# EasyEDA Pro project 4轴机器狗主控板_ProDoc_Board1_2026-10-02.epro, board PCB1
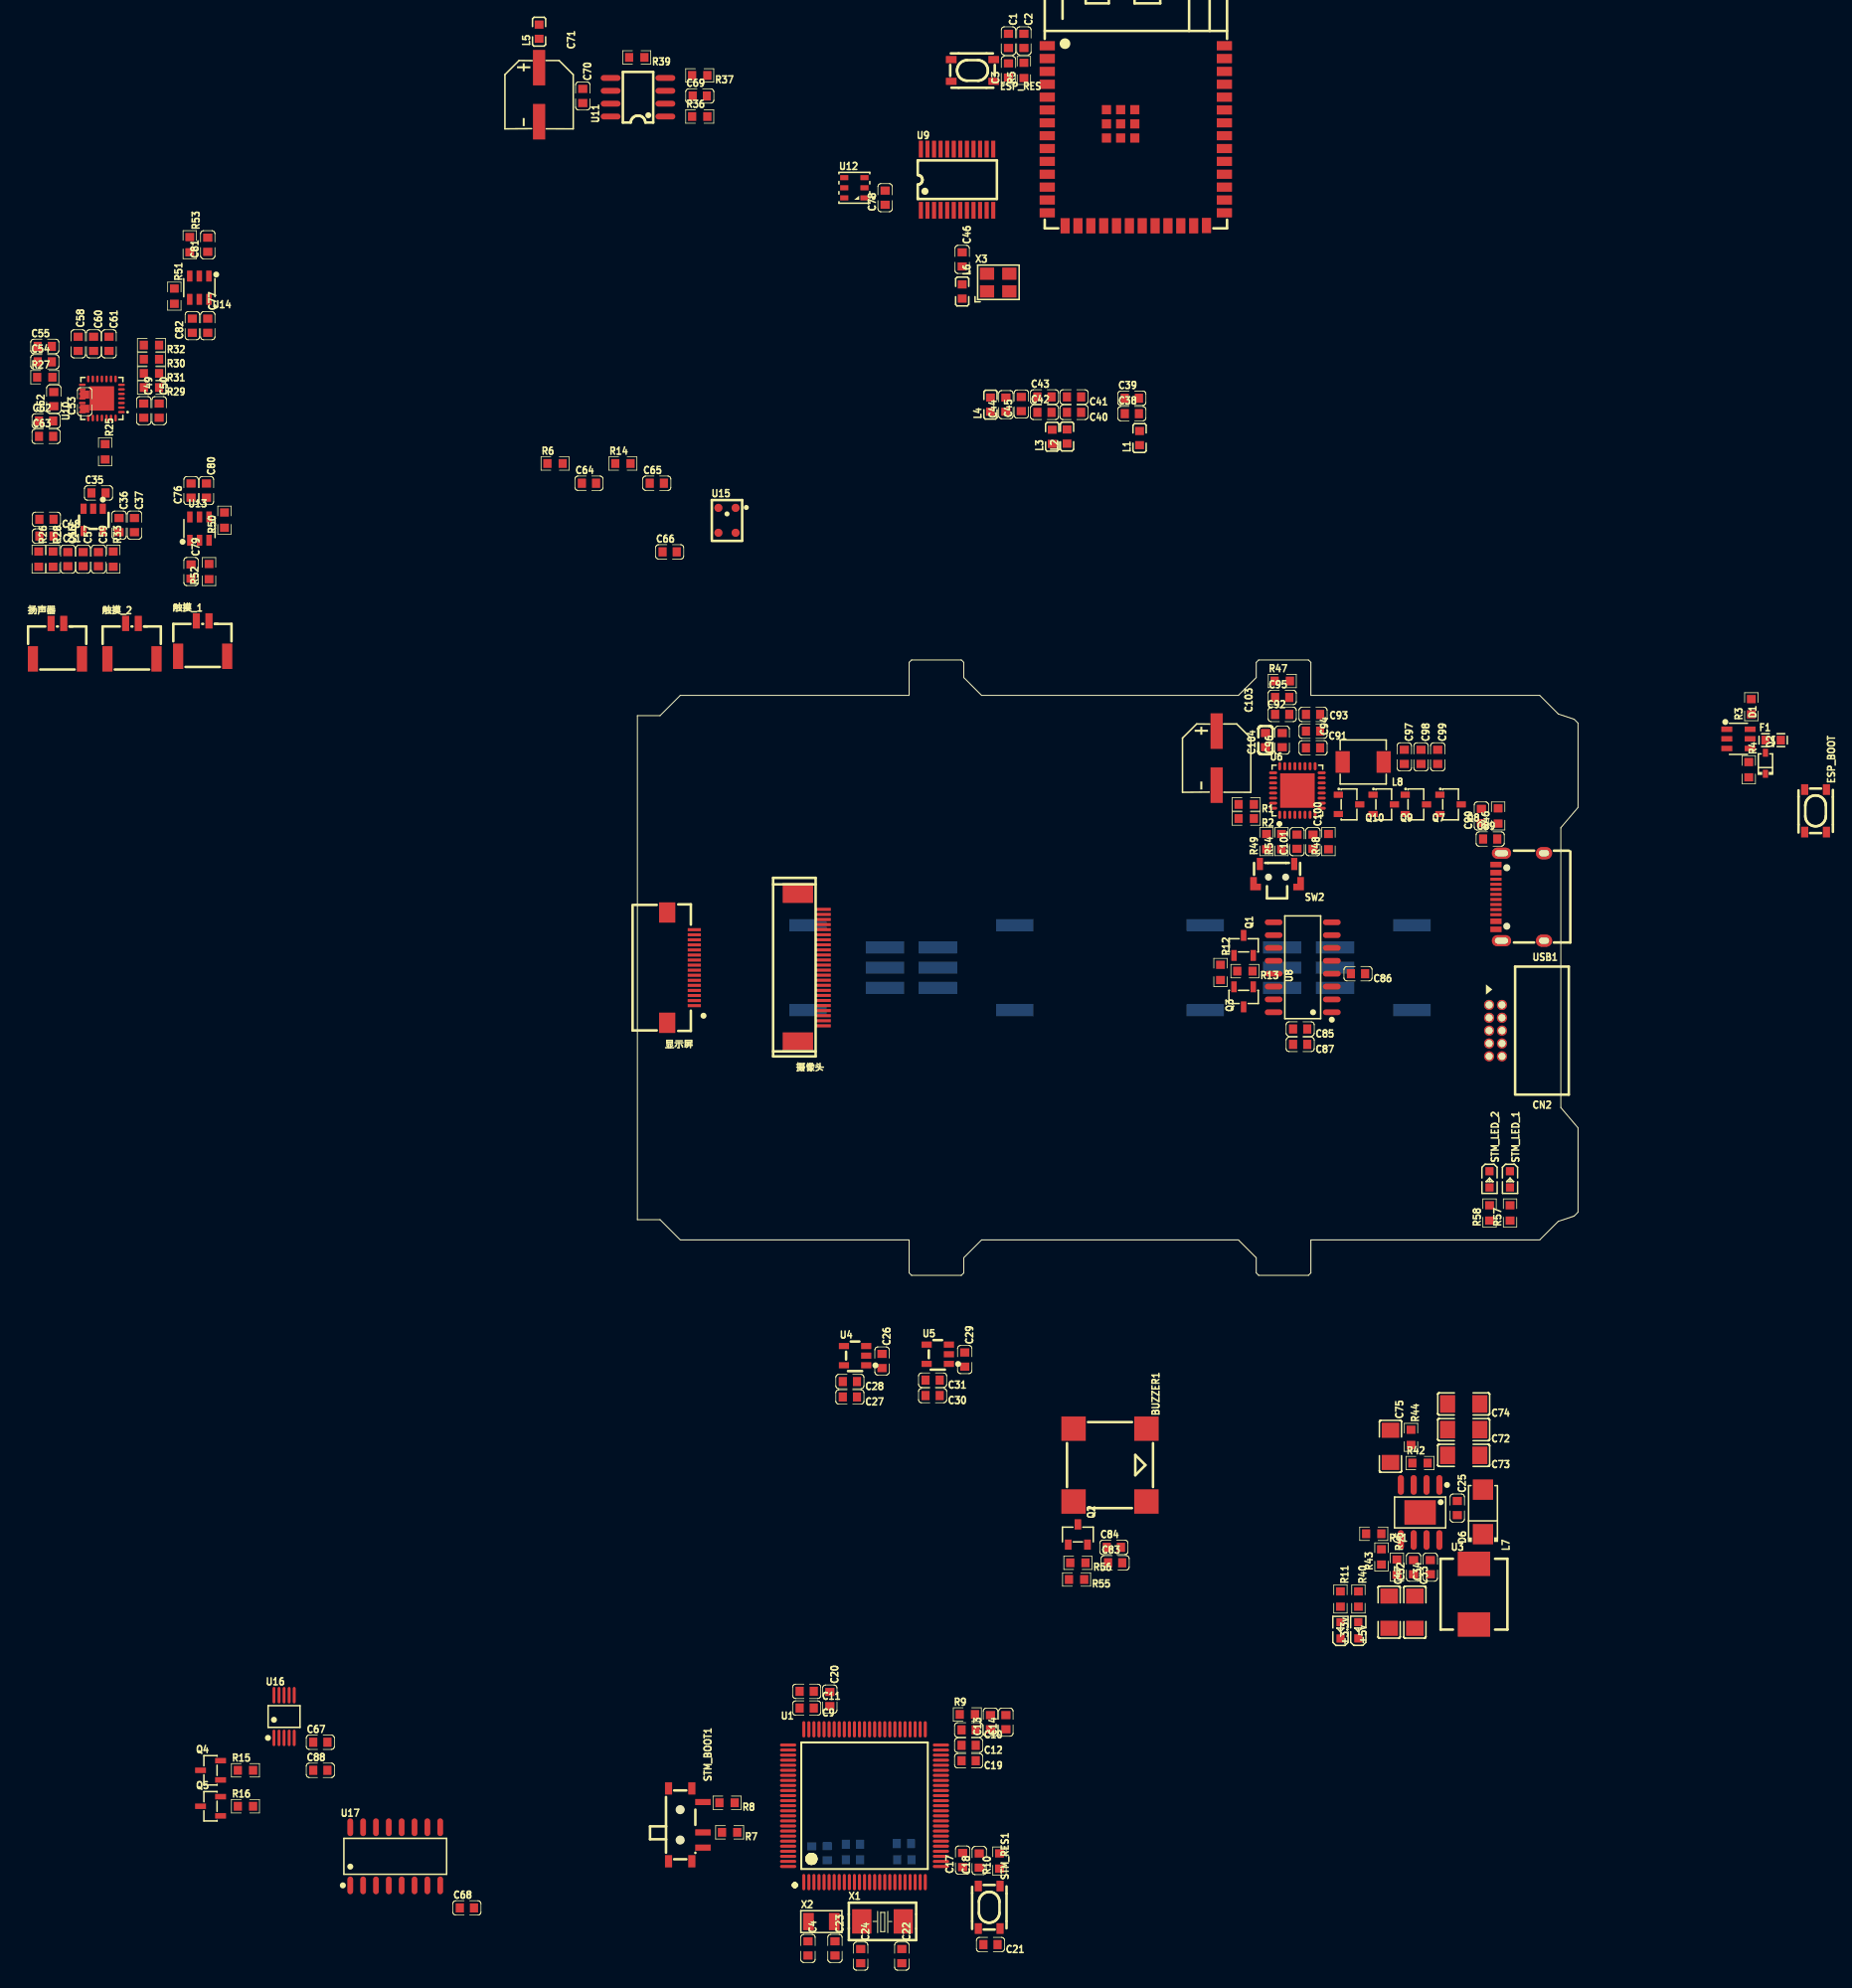
[diagram p9: board, top side]
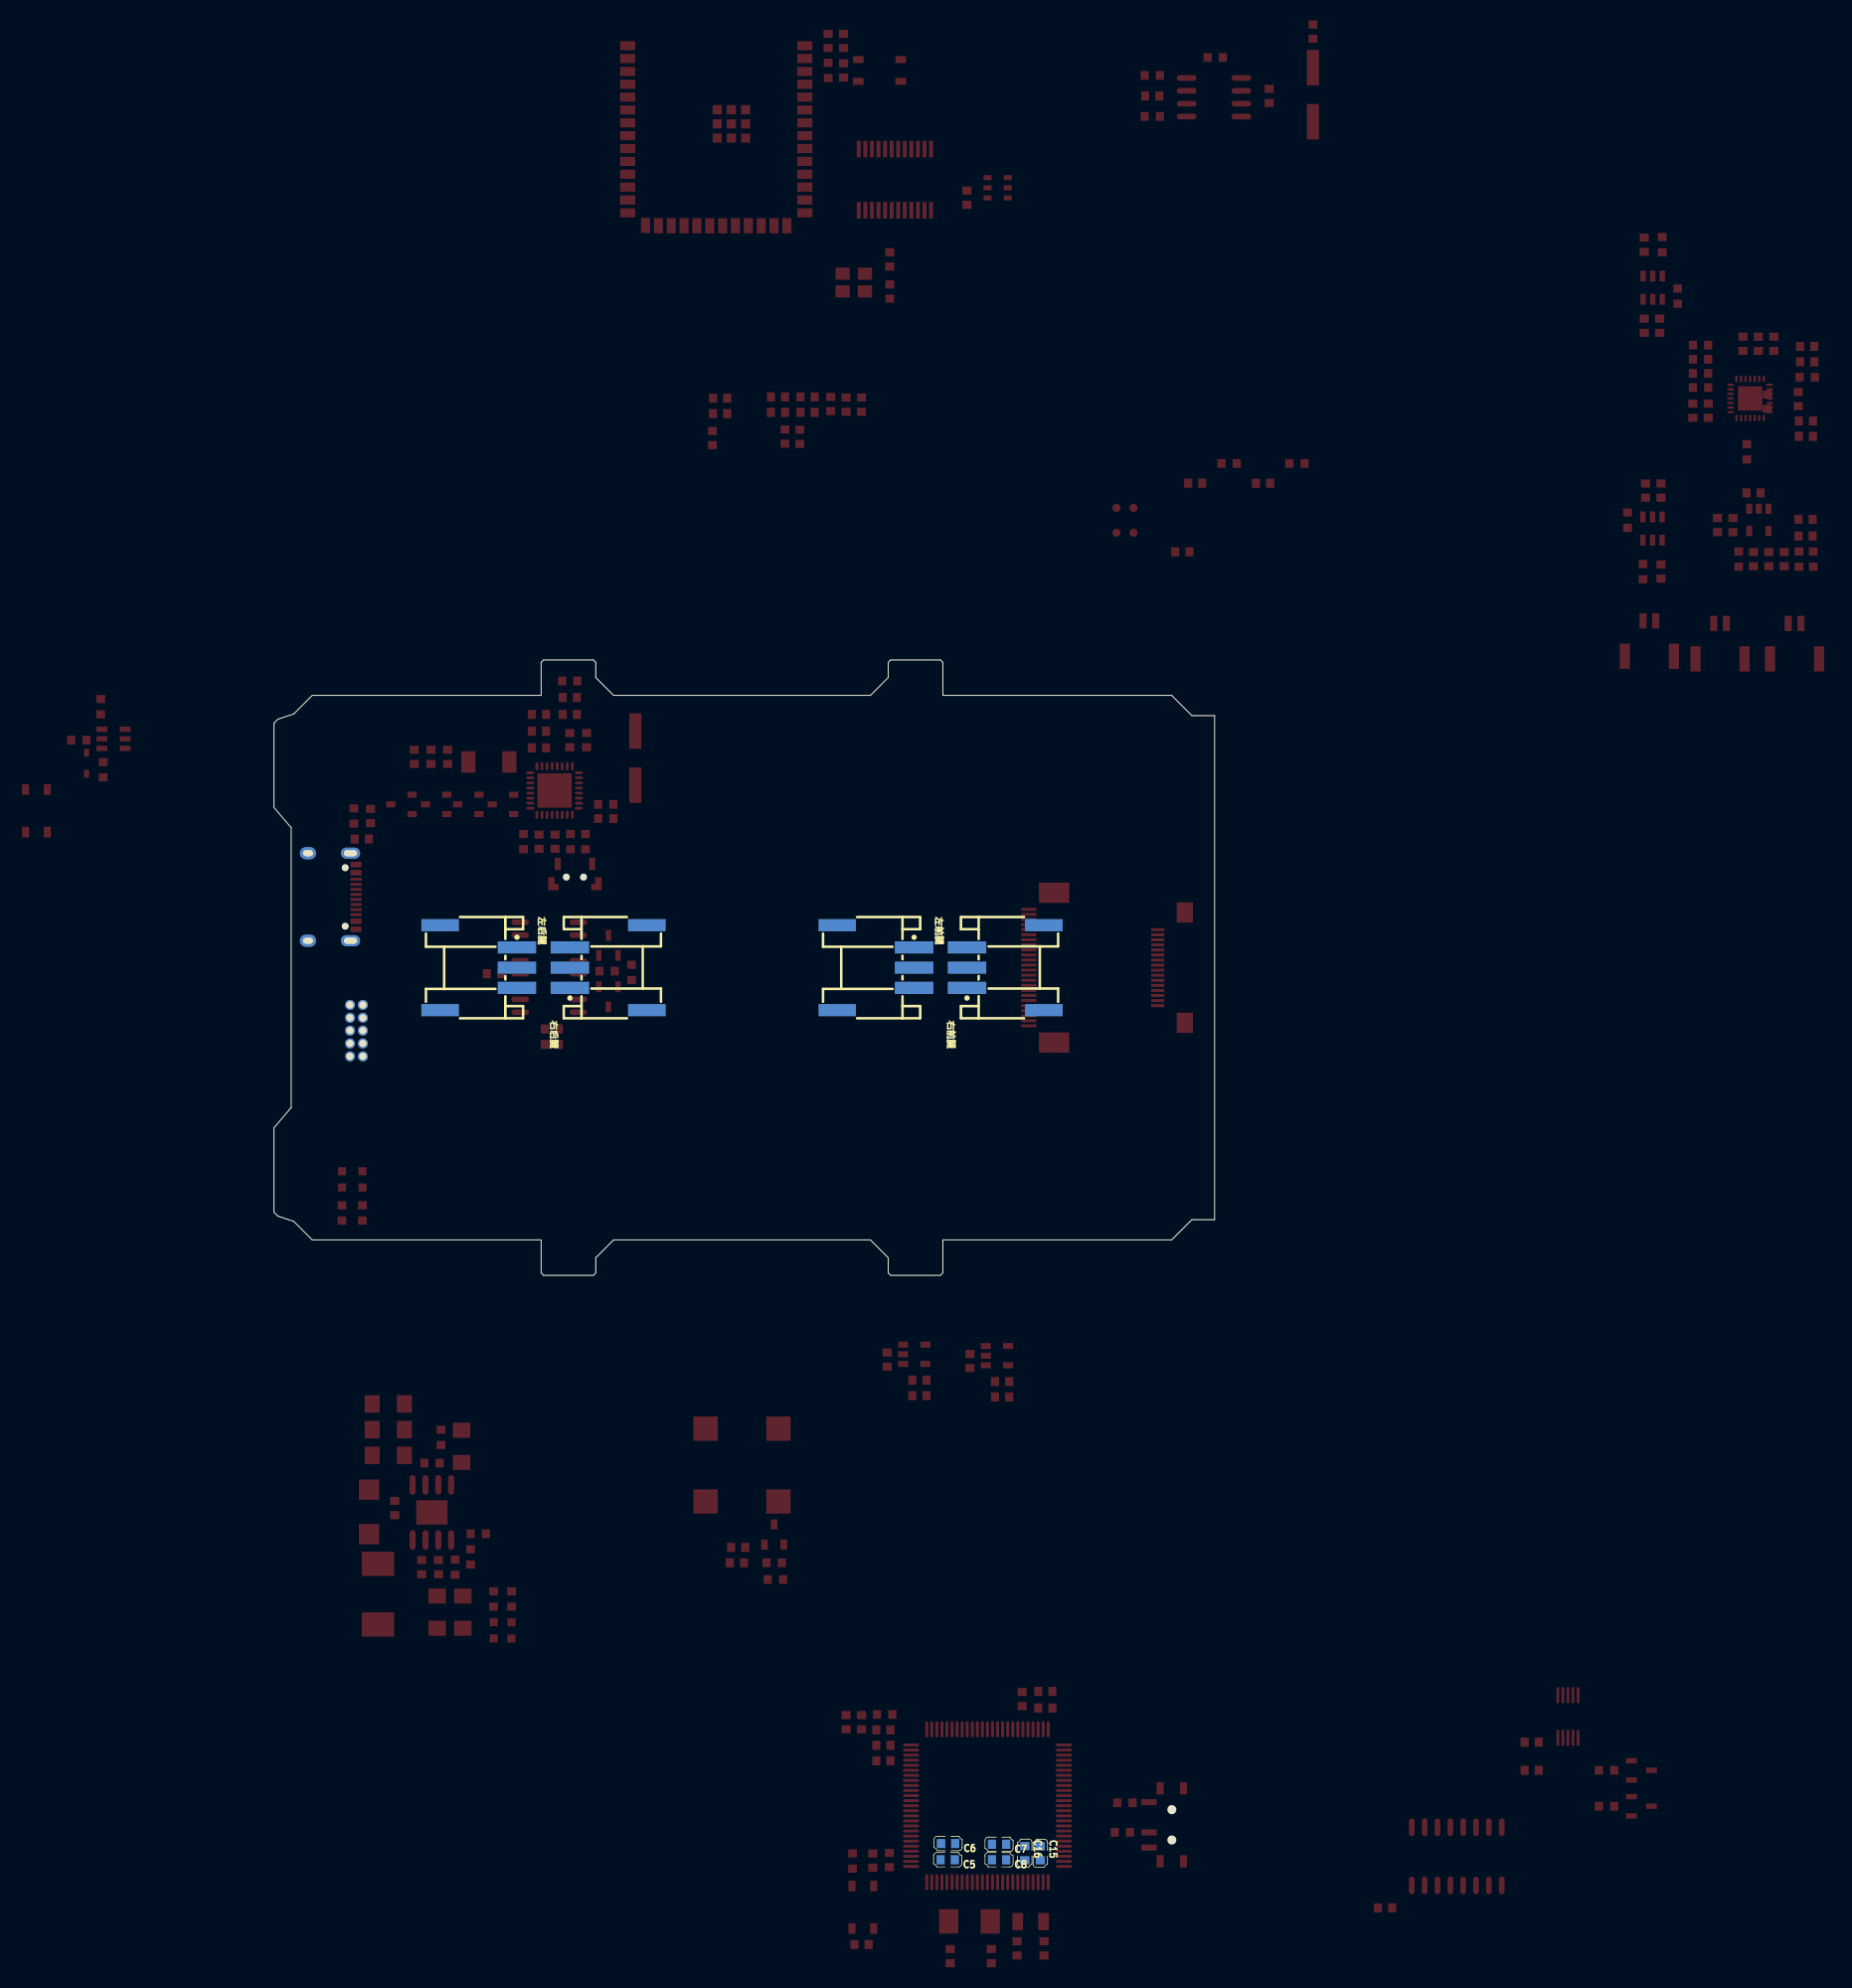
[diagram p10: board, bottom side, seen from below]

Outline 92.95 x 117.04 mm; copper layers: Top Layer, Bottom Layer. Coordinates in mm from the lower left corner of the outline.
Outline path: 0,111.54 2.24,111.54 4.24,113.54 26.85,113.54 26.85,116.8 27.09,117.04 32.01,117.04 32.25,116.8 32.25,115.3 34.01,113.54 59.39,113.54 61.15,115.3 61.15,116.8 61.39,117.04 66.31,117.04 66.55,116.8 66.55,113.54 89.16,113.54 91,111.7 92.57,111.18 92.95,110.8 92.95,102.47 91.25,100.47 91.25,72.81 92.95,70.81 92.95,62.48 92.57,62.1 91,61.57 89.16,59.74 66.55,59.74 66.55,56.48 66.31,56.24 61.39,56.24 61.15,56.48 61.15,57.98 59.39,59.74 34.01,59.74 32.25,57.98 32.25,56.48 32.01,56.24 27.09,56.24 26.85,56.48 26.85,59.74 4.24,59.74 2.24,61.74 0,61.74 0,111.54
Stack: Top Layer 0.035mm / Dielectric1 1.51mm FR4 er 4.5 / Bottom Layer 0.035mm

## Design rules (mm)
spacing copperThickness1oz (default): track to track 0.102, other pairs 0.152 to 0.3
spacing copperThickness2oz: track to track 0.203, other pairs 0.152 to 0.3
track width copperThickness1oz (default): min 0.127, default 0.254, max 2.54
track width copperThickness2oz: min 0.203, default 0.254, max 2.54
differential pair differentialPair (default): width min 0.127, default 0.254, max 2.54; gap min 0.152, default 0.152

## Placement (name value [footprint] x y rotation side)
+3.3v  -  [LED_0603]  71.23 21.22 90 top
+5v  -  [LED_0603]  69.47 21.21 90 top
BUZZER1  2.7kHz  [BUZ-SMD_4P-L8.5-W8.5-P8.50-BR]  46.7 37.49 270 top
C1  22uF  [C0603]  36.67 178.21 270 top
C2  100nF  [C0603]  38.19 178.21 270 top
C3  1uF  [C0603]  36.67 175.28 90 top
C4  22pF  [C0603]  16.86 -10.26 270 top
C5  100nF  [C0603]  26.38 -1.5 0 bottom
C6  100nF  [C0603]  26.33 0.1 0 bottom
C7  100nF  [C0603]  21.3 0.02 0 bottom
C8  100nF  [C0603]  21.3 -1.5 0 bottom
C9  100nF  [C0603]  16.73 13.49 180 top
C10  100nF  [C0603]  32.73 11.33 180 top
C11  4.7uF  [C0603]  16.73 15.14 180 top
C12  4.7uF  [C0603]  32.73 9.8 180 top
C13  10nF  [C0603]  34.89 12.09 90 top
C14  1uF  [C0603]  36.41 12.09 90 top
C15  100nF  [C0603]  17.22 -0.87 270 bottom
C16  1uF  [C0603]  18.76 -0.85 270 bottom
C17  100nF  [C0603]  32.14 -1.53 90 top
C18  1uF  [C0603]  33.78 -1.58 90 top
C19  2.2uF  [C0603]  32.73 8.28 180 top
C20  2.2uF  [C0603]  19.01 14.38 270 top
C21  100nF  [C0603]  34.89 -9.88 180 top
C22  22pF  [C0603]  26.13 -11.02 270 top
C23  22pF  [C0603]  19.52 -10.26 270 top
C24  22pF  [C0603]  22.06 -11.02 270 top
C25  100nF  [C0603]  81.02 33.25 270 top
C26  10uF  [C0603]  24.17 47.78 270 top
C27  100nF  [C0603]  21 44.22 180 top
C28  10uF  [C0603]  21 45.74 180 top
C29  10uF  [C0603]  32.34 47.92 270 top
C30  100nF  [C0603]  29.17 44.36 180 top
C31  10uF  [C0603]  29.17 45.88 180 top
C32  1000pF  [C0603]  76.7 27.4 90 top
C33  47µF  [C1206]  76.83 22.96 270 top
C34  47pF  [C0603]  78.35 27.4 90 top
C35  10uF  [C0603]  -53.26 133.54 0 top
C36  100nF  [C0603]  -51.22 130.36 270 top
C37  10uF  [C0603]  -49.7 130.36 270 top
C38  100nF  [C0603]  48.86 141.38 0 top
C39  10uF  [C0603]  48.86 142.9 0 top
C40  100nF  [C0603]  43.14 141.5 180 top
C41  10uF  [C0603]  43.14 143.03 180 top
C42  100nF  [C0603]  40.22 141.5 0 top
C43  10uF  [C0603]  40.22 143.03 0 top
C44  100nF  [C0603]  36.41 142.26 90 top
C45  10uF  [C0603]  37.93 142.33 90 top
C46  100nF  [C0603]  32.1 156.62 270 top
C47  47µF  [C1206]  74.29 22.96 270 top
C48  10uF  [C0603]  -58.4 130.93 180 top
C49  10uF  [C0603]  -48.78 141.67 270 top
C50  10uF  [C0603]  -47.26 141.67 270 top
C51  100nF  [C0603]  -58.4 129.28 180 top
C52  100nF  [C0603]  -57.67 142.81 90 top
C53  10uF  [C0603]  -54.63 142.56 90 top
C54  100nF  [C0603]  -58.56 146.49 0 top
C55  10uF  [C0603]  -58.56 148.02 0 top
C56  10nF  [C0603]  -56.28 127 270 top
C57  100nF  [C0603]  -54.77 127 270 top
C58  1uF  [C0603]  -55.26 148.27 270 top
C59  100nF  [C0603]  -53.26 127 270 top
C60  1uF  [C0603]  -53.74 148.27 270 top
C61  10uF  [C0603]  -52.21 148.27 270 top
C62  10uF  [C0603]  -58.44 140.65 0 top
C63  10uF  [C0603]  -58.44 139.13 0 top
C64  10µF  [C0603]  -4.79 134.5 0 top
C65  100nF  [C0603]  1.92 134.5 0 top
C66  10µF  [C0603]  3.19 127.72 0 top
C67  10uF  [C0603]  -31.34 10.11 0 top
C68  100nF  [C0603]  -16.85 -6.26 0 top
C69  10uF  [C0603]  6.16 172.76 0 top
C70  100nF  [C0603]  -5.4 172.76 270 top
C71  220uF  [CAP-SMD_BD6.3-L6.6-W6.6-LS7.4-FD]  -9.72 172.89 270 top
C72  4.7µF  [C1206]  81.65 40.99 180 top
C73  4.7µF  [C1206]  81.65 38.45 180 top
C74  10 nF  [C1206]  81.65 43.53 180 top
C75  10 nF  [C1206]  74.41 39.34 270 top
C76  4.7nF  [C0603]  -44.11 133.77 90 top
C77  4.7nF  [C0603]  -42.46 150.06 270 top
C78  10uF  [C0603]  24.48 162.71 90 top
C79  5pF  [C0603]  -44.11 125.77 270 top
C80  100nF  [C0603]  -42.59 133.77 270 top
C81  5pF  [C0603]  -42.46 158.06 90 top
C82  100nF  [C0603]  -43.98 150.06 90 top
C83  100nF  [C0603]  47.21 27.84 0 top
C84  10uF  [C0603]  47.08 29.36 0 top
C85  10uF  [C0603]  65.49 80.58 180 top
C86  100nF  [C0603]  71.21 86.04 180 top
C87  100nF  [C0603]  65.49 79.06 180 top
C88  100nF  [C0603]  -31.34 7.33 0 top
C89  100nF  [C0603]  84.27 99.35 0 top
C90  100nF  [C0603]  83.4 101.62 90 top
C91  100nF  [C0603]  66.77 110.01 180 top
C92  100nF  [C0603]  63.72 111.66 0 top
C93  100nF  [C0603]  66.77 111.66 180 top
C94  100nF  [C0603]  66.77 108.36 180 top
C95  100nF  [C0603]  63.72 113.33 0 top
C96  100nF  [C0603]  63.72 109.12 90 top
C97  100nF  [C0603]  75.78 107.47 270 top
C98  100nF  [C0603]  77.43 107.47 270 top
C99  100nF  [C0603]  79.08 107.47 270 top
C100  100nF  [C0603]  66.76 99.08 270 top
C101  100nF  [C0603]  65.18 99.08 90 top
C103  220uF  [CAP-SMD_BD6.3-L6.6-W6.6-LS7.4-FD]  57.24 107.34 270 top
C104  10uF  [C0603]  62.07 109.12 90 top
CN2  X1270WR-2x05B-9TV01  [CONN-TH_10P-P1.27_XKB_X1270WR-2X05B-6TV01]  84.8 80.42 90 top
D1  USBLC6-2SC6  [SOT-23-6_L2.9-W1.6-P0.95-LS2.8-BL]  108.8 109.24 270 top
D2  B5819WS  [SOD-323_L1.7-W1.3-LS2.5-FD]  111.47 106.83 270 top
D6  B340A-E3/61T  [SMA_L4.3-W2.6-LS5.2-RD]  83.56 32.86 90 top
ESP_BOOT  TSA016A2518A  [KEY-SMD_4P-L4.2-W3.4-P2.15-LS4.5-TL]  116.42 102.13 270 top
ESP_RES  TSA016A2518A  [KEY-SMD_4P-L4.2-W3.4-P2.15-LS4.5-TL]  33.11 175.28 180 top
F1  BSMD0603-050-6V  [F0603]  112.23 109.12 0 top
L1  BLM18PG121SN1D  [L0603]  49.62 138.96 90 top
L2  BLM18PG121SN1D  [L0603]  42.46 139.11 90 top
L3  BLM18PG121SN1D  [L0603]  40.98 139.09 90 top
L4  BLM18PG121SN1D  [L0603]  34.89 142.26 90 top
L5  BLM18PG121SN1D  [L0603]  -9.72 179.11 90 top
L6  BLM18PG121SN1D  [L0603]  32.1 153.44 270 top
L7  6.8uH  [IND-SMD_L7.0-W6.6]  82.67 24.74 270 top
L8  1uH  [IND-SMD_L4.4-W4.2]  71.72 106.96 180 top
Q1  S8050  [SOT-23-3_L2.9-W1.3-P1.90-LS2.3-BR]  59.9 88.83 270 top
Q2  SI2302  [SOT-23-3_L2.9-W1.3-P1.90-LS2.4-BR]  43.52 30.63 270 top
Q3  S8050  [SOT-23-3_L2.9-W1.3-P1.90-LS2.3-BR]  59.9 83.75 90 top
Q4  S8050  [SOT-23-3_L2.9-W1.3-P1.90-LS2.3-BR]  -42.18 7.33 0 top
Q5  S8050  [SOT-23-3_L2.9-W1.3-P1.90-LS2.3-BR]  -42.18 3.78 0 top
Q7  AO3401  [SOT-23-3_L2.9-W1.4-P1.90-LS2.6-BR]  76.93 102.77 180 top
Q8  AO3401  [SOT-23-3_L2.9-W1.4-P1.90-LS2.6-BR]  80.36 102.77 180 top
Q9  AO3401  [SOT-23-3_L2.9-W1.4-P1.90-LS2.6-BR]  73.75 102.77 180 top
Q10  AO3401  [SOT-23-3_L2.9-W1.4-P1.90-LS2.6-BR]  70.32 102.77 180 top
R1  10K  [R0603]  60.16 102.77 180 top
R2  10K  [R0603]  60.16 101.37 180 top
R3  22Ω  [R0603]  110.07 112.42 90 top
R4  22Ω  [R0603]  109.82 106.2 270 top
R5  10K  [R0603]  38.19 175.28 90 top
R6  2K  [R0603]  -8.14 136.45 0 top
R7  10K  [R0603]  9.11 1.21 180 top
R8  10K  [R0603]  8.86 4.13 180 top
R9  10Ω  [R0603]  32.6 12.85 0 top
R10  10K  [R0603]  35.78 -1.63 90 top
R11  1K  [R0603]  69.47 24.26 270 top
R12  10K  [R0603]  57.62 86.17 270 top
R13  10K  [R0603]  60.03 86.29 180 top
R14  2K  [R0603]  -1.44 136.45 0 top
R15  10K  [R0603]  -38.73 7.33 0 top
R16  10K  [R0603]  -38.73 3.78 0 top
R25  0Ω  [R0603]  -52.59 137.6 270 top
R26  2K  [R0603]  -59.16 127 270 top
R27  10Ω  [R0603]  -58.56 144.97 0 top
R28  2K  [R0603]  -57.75 127 270 top
R29  22Ω  [R0603]  -48.02 143.95 180 top
R30  22Ω  [R0603]  -48.02 146.75 180 top
R31  22Ω  [R0603]  -48.02 145.35 180 top
R32  22Ω  [R0603]  -48.02 148.15 180 top
R33  10K  [R0603]  -51.8 127 270 top
R36  100k  [R0603]  6.16 170.73 0 top
R37  5.6K  [R0603]  6.16 174.79 180 top
R39  20K  [R0603]  -0.07 176.57 180 top
R40  1K  [R0603]  71.25 24.26 270 top
R41  10.2K  [R0603]  72.76 30.71 180 top
R42  133kΩ  [R0603]  77.33 37.69 0 top
R43  3.24K  [R0603]  73.52 28.42 90 top
R44  32.8kΩ  [R0603]  76.45 40.23 270 top
R45  29.4K  [R0603]  75.05 27.4 270 top
R46  10K  [R0603]  85.05 101.62 90 top
R47  10K  [R0603]  63.72 114.96 0 top
R48  10K  [R0603]  68.29 99.09 90 top
R49  10K  [R0603]  62.17 99.09 90 top
R50  10K  [R0603]  -40.81 130.85 90 top
R51  10K  [R0603]  -45.76 152.98 270 top
R52  2K  [R0603]  -42.33 125.77 90 top
R53  2K  [R0603]  -44.24 158.07 270 top
R54  10K  [R0603]  63.65 99.09 90 top
R55  100Ω  [R0603]  43.4 26.19 180 top
R56  100 kΩ  [R0603]  43.52 27.84 180 top
R57  1K  [R0603]  86.23 62.4 90 top
R58  1K  [R0603]  84.21 62.4 90 top
STM_BOOT1  MSK12C02  [SW-TH_MSK12C02]  4.78 1.95 270 top
STM_LED_1  -  [LED_0603]  86.23 65.67 270 top
STM_LED_2  -  [LED_0603]  84.21 65.67 270 top
STM_RES1  TSA016A2518A  [KEY-SMD_4P-L4.2-W3.4-P2.15-LS4.5-TL]  34.76 -6.2 270 top
SW2  TS24CA  [SW-SMD_2P-TS24CA]  63.21 95.91 180 top
U1  STM32F407VET6  [LQFP-100_L14.0-W14.0-P0.50-LS16.0-BL]  22.44 3.83 0 top
U2  2.4GHz  [WIRELM-SMD_ESP32-S3-WROOM-1]  49.25 168.83 0 top
U3  TPS54331DDAR  [SOIC-8_L4.9-W3.9-P1.27-LS6.0-BL-EP]  77.34 32.81 180 top
U4  RT9013-28GB  [SOT-23-5_L2.9-W1.6-P0.95-LS2.8-BR]  21.51 48.3 0 top
U5  RT9013-15GB  [SOT-23-5_L2.9-W1.6-P0.95-LS2.8-BR]  29.68 48.44 0 top
U6  IP5310_I2C  [QFN-32_L5.0-W5.0-P0.50-BL-EP3.4]  65.22 104.14 0 top
U7  RT9013-33GB-MS  [SOT-23-5_L2.9-W1.6-P0.95-LS2.8-BR]  -53.78 130.88 90 top
U8  CH340C  [SOP-16_L10.0-W3.9-P1.27-LS6.0-BL]  65.75 86.68 90 top
U9  XL9555  [TSSOP-24_L7.8-W4.4-P0.65-LS6.4-BL]  31.59 164.49 0 top
U10  ES8388  [QFN-28_L4.0-W4.0-P0.45-BL-EP]  -52.92 142.88 90 top
U11  MS8002A  [SOIC-8_L5.0-W4.0-P1.27-LS6.0-BL]  0.06 172.63 90 top
U12  AHT20  [SENSOR-SMD_L3.0-W3.0-P1.00-BR]  21.44 163.69 0 top
U13  AI01C  [SOT-23-6_L2.9-W1.6-P0.95-LS2.8-BL]  -43.28 130.02 0 top
U14  AI01C  [SOT-23-6_L2.9-W1.6-P0.95-LS2.8-BL]  -43.29 153.82 180 top
U15  LCA3729T381-OAC03  [MIC-SMD_4P-L3.8-W3.0_LMA3729T421-OA1]  8.85 130.83 0 top
U16  CH340E  [MSOP-10_L3.0-W3.0-P0.50-LS5.0-BL]  -34.92 12.65 0 top
U17  CH340C  [SOP-16_L10.0-W3.9-P1.27-LS6.0-BL]  -23.93 -1.16 0 top
USB1  TYPE-C 16PIN 2MD(073)  [USB-C-SMD_TYPE-C-16PIN-2MD-073]  87.21 93.62 90 top
X1  8MHz  [CRYSTAL-SMD_L5.0-W3.2]  24.22 -7.6 0 top
X2  32.768kHz  [CRYSTAL-SMD_L3.2-W1.5-1]  18.18 -7.61 0 top
X3  24MHz  [OSC-SMD_4P-L3.2-W2.5-BL]  35.65 154.33 0 top
右前腿  2.0-3PWTDK  [CONN-SMD_3P-P2.00_SHOU_2.0-3PWTDK]  20.67 86.64 90 bottom
右后腿  2.0-3PWTDK  [CONN-SMD_3P-P2.00_SHOU_2.0-3PWTDK]  59.91 86.64 90 bottom
左前腿  2.0-3PWTDK  [CONN-SMD_3P-P2.00_SHOU_2.0-3PWTDK]  33.49 86.64 270 bottom
左后腿  2.0-3PWTDK  [CONN-SMD_3P-P2.00_SHOU_2.0-3PWTDK]  72.73 86.64 270 bottom
扬声器  1.25-2PLTDK  [CONN-SMD_2P-P1.25_SHOUHAN_1.25-2PLTDK]  -57.31 118.9 0 top
摄像头  AFC07-S24ECC-00  [FPC-SMD_24P-L17.5-W5.4-P0.50]  17.11 86.64 270 top
显示屏  AFC01-S16FCA-00  [FPC-SMD_P0.50-16P_FGS-XJ-H2.0]  4.28 86.64 90 top
触摸_1  1.25-2PLTDK  [CONN-SMD_2P-P1.25_SHOUHAN_1.25-2PLTDK]  -42.96 119.15 0 top
触摸_2  1.25-2PLTDK  [CONN-SMD_2P-P1.25_SHOUHAN_1.25-2PLTDK]  -49.95 118.9 0 top

## Footprints (pads in the part's own frame, mm; a bottom-side part is the same pattern mirrored in y, then rotated)
BUZ-SMD_4P-L8.5-W8.5-P8.50-BR
  rect 2.4x2.4 smd: 1(-3.6,-3.6) 2(3.6,-3.6) 3(3.599,3.599) 4(-3.6,3.6)
C0603
  rect 0.8x0.9 smd: 1(-0.7,0) 2(0.7,0)
C1206
  rect 1.485x1.728 smd: 1(-1.593,0) 2(1.593,0)
CAP-SMD_BD6.3-L6.6-W6.6-LS7.4-FD
  rect 3.5x1.2 smd: 1(-2.67,0) 2(2.67,0)
CONN-SMD_2P-P1.25_SHOUHAN_1.25-2PLTDK
  rect 0.7x1.5 smd: 1(-0.625,1.75) 2(0.625,1.75)
  rect 1x2.5 smd: 3(2.425,-1.75) 4(-2.425,-1.75)
CONN-SMD_3P-P2.00_SHOU_2.0-3PWTDK
  rect 1.2x3.8 smd: 1(-2,3.8) 2(0,3.8) 3(2,3.8)
  rect 1.2x3.7 smd: 4(4.2,-3.8) 5(-4.2,-3.8)
CONN-TH_10P-P1.27_XKB_X1270WR-2X05B-6TV01
  round 1 hole 0.7: 1(2.54,0.635) 2(2.54,-0.635) 3(1.27,0.635) 4(1.27,-0.635) 5(0,0.635) 6(0,-0.635) 7(-1.27,0.635) 8(-1.27,-0.635) 9(-2.54,0.635) 10(-2.54,-0.635)
CRYSTAL-SMD_L3.2-W1.5-1
  rect 1.05x1.7 smd: 1(-1.275,0) 2(1.275,0)
CRYSTAL-SMD_L5.0-W3.2
  rect 1.9x2.4 smd: 1(-2.05,0) 2(2.05,0)
F0603
  rect 0.806x0.864 smd: 1(-0.753,0) 2(0.753,0)
FPC-SMD_24P-L17.5-W5.4-P0.50
  rect 0.3x1.5 smd: 1(5.745,1.25) 2(5.245,1.25) 3(4.745,1.25) 4(4.245,1.25) 5(3.745,1.25) 6(3.245,1.25) 7(2.745,1.25) 8(2.245,1.25) 9(1.746,1.25) 10(1.246,1.25) 11(0.746,1.25) 12(0.245,1.25) 13(-0.255,1.25) 14(-0.754,1.25) 15(-1.25,1.25) 16(-1.754,1.25) 17(-2.255,1.25) 18(-2.754,1.25) 19(-3.254,1.25) 20(-3.756,1.25) 21(-4.256,1.25) 22(-4.756,1.25) 23(-5.256,1.25) 24(-5.756,1.25)
  rect 2x3 smd: 25(-7.401,-1.25) 26(7.401,-1.25)
FPC-SMD_P0.50-16P_FGS-XJ-H2.0
  rect 0.3x1.3 smd: 1(-3.752,-1.34) 2(-3.254,-1.339) 3(-2.752,-1.34) 4(-2.252,-1.34) 5(-1.752,-1.34) 6(-1.252,-1.34) 7(-0.752,-1.34) 8(-0.252,-1.34) 9(0.248,-1.34) 10(0.748,-1.34) 11(1.248,-1.34) 12(1.748,-1.34) 13(2.248,-1.34) 14(2.748,-1.34) 15(3.248,-1.34) 16(3.748,-1.34)
  rect 2x1.6 smd: 17(-5.45,1.34) 18(5.45,1.34)
IND-SMD_L4.4-W4.2
  rect 1.4x2.12 smd: 1(2.028,0) 2(-2.028,0)
IND-SMD_L7.0-W6.6
  rect 2.4x3.2 smd: 1(-3,0) 2(3,0)
KEY-SMD_4P-L4.2-W3.4-P2.15-LS4.5-TL
  rect 1.05x0.7 smd: 1(-2.1,1.075) 2(2.1,1.075) 3(-2.1,-1.075) 4(2.1,-1.075)
L0603
  rect 0.8x0.864 smd: 1(-0.7,0) 2(0.7,0)
LED_0603
  rect 0.8x0.8 smd: 1(-0.851,-0.01) 2(0.75,-0.005)
LQFP-100_L14.0-W14.0-P0.50-LS16.0-BL
  oval 0.3x1.6 smd: 1(-6,-7.55) 2(-5.5,-7.55) 3(-5,-7.55) 4(-4.5,-7.55) 5(-4,-7.55) 6(-3.5,-7.55) 7(-3,-7.55) 8(-2.5,-7.55) 9(-2,-7.55) 10(-1.5,-7.55) 11(-1,-7.55) 12(-0.5,-7.55) 13(0,-7.55) 14(0.5,-7.55) 15(1,-7.55) 16(1.5,-7.55) 17(2,-7.55) 18(2.5,-7.55) 19(3,-7.55) 20(3.5,-7.55) 21(4,-7.55) 22(4.5,-7.55) 23(5,-7.55) 24(5.5,-7.55) 25(6,-7.55) 51(6,7.55) 52(5.5,7.55) 53(5,7.55) 54(4.5,7.55) 55(4,7.55) 56(3.5,7.55) 57(3,7.55) 58(2.5,7.55) 59(2,7.55) 60(1.5,7.55) 61(1,7.55) 62(0.5,7.55) 63(0,7.55) 64(-0.5,7.55) 65(-1,7.55) 66(-1.5,7.55) 67(-2,7.55) 68(-2.5,7.55) 69(-3,7.55) 70(-3.5,7.55) 71(-4,7.55) 72(-4.5,7.55) 73(-5,7.55) 74(-5.5,7.55) 75(-6,7.55)
  oval 1.6x0.3 smd: 26(7.55,-6) 27(7.55,-5.5) 28(7.55,-5) 29(7.55,-4.5) 30(7.55,-4) 31(7.55,-3.5) 32(7.55,-3) 33(7.55,-2.5) 34(7.55,-2) 35(7.55,-1.5) 36(7.55,-1) 37(7.55,-0.5) 38(7.55,0) 39(7.55,0.5) 40(7.55,1) 41(7.55,1.5) 42(7.55,2) 43(7.55,2.5) 44(7.55,3) 45(7.55,3.5) 46(7.55,4) 47(7.55,4.5) 48(7.55,5) 49(7.55,5.5) 50(7.55,6) 76(-7.55,6) 77(-7.55,5.5) 78(-7.55,5) 79(-7.55,4.5) 80(-7.55,4) 81(-7.55,3.5) 82(-7.55,3) 83(-7.55,2.5) 84(-7.55,2) 85(-7.55,1.5) 86(-7.55,1) 87(-7.55,0.5) 88(-7.55,0) 89(-7.55,-0.5) 90(-7.55,-1) 91(-7.55,-1.5) 92(-7.55,-2) 93(-7.55,-2.5) 94(-7.55,-3) 95(-7.55,-3.5) 96(-7.55,-4) 97(-7.55,-4.5) 98(-7.55,-5) 99(-7.55,-5.5) 100(-7.55,-6)
MIC-SMD_4P-L3.8-W3.0_LMA3729T421-OA1
  round 0.8 smd: 1(0.85,1.23) 2(-0.85,1.23) 3(0.85,-1.23) 4(-0.85,-1.23)
MSOP-10_L3.0-W3.0-P0.50-LS5.0-BL
  oval 0.28x1.62 smd: 1(-1,-2.11) 2(-0.5,-2.11) 3(0,-2.11) 4(0.5,-2.11) 5(1,-2.11) 6(1,2.11) 7(0.5,2.11) 8(0,2.11) 9(-0.5,2.11) 10(-1,2.11)
OSC-SMD_4P-L3.2-W2.5-BL
  rect 1.4x1.2 smd: 1(-1.1,-0.875) 2(1.1,-0.875) 3(1.1,0.875) 4(-1.1,0.875)
QFN-28_L4.0-W4.0-P0.45-BL-EP
  oval 0.23x0.665 smd: 1(-1.349,-1.931) 2(-0.898,-1.931) 3(-0.449,-1.931) 4(0.002,-1.931) 5(0.452,-1.931) 6(0.901,-1.931) 7(1.351,-1.931) 15(1.351,1.931) 16(0.901,1.931) 17(0.452,1.931) 18(0.002,1.931) 19(-0.449,1.931) 20(-0.898,1.931) 21(-1.349,1.931)
  oval 0.665x0.23 smd: 8(1.931,-1.351) 9(1.931,-0.901) 10(1.931,-0.452) 11(1.931,-0.002) 12(1.931,0.449) 13(1.931,0.898) 14(1.931,1.349) 22(-1.931,1.349) 23(-1.931,0.898) 24(-1.931,0.449) 25(-1.931,-0.002) 26(-1.931,-0.452) 27(-1.931,-0.901) 28(-1.931,-1.351)
  rect 2.4x2.4 smd: 29(0,0)
QFN-32_L5.0-W5.0-P0.50-BL-EP3.4
  oval 0.28x0.8 smd: 1(-1.75,-2.4) 2(-1.25,-2.4) 3(-0.75,-2.4) 4(-0.25,-2.4) 5(0.25,-2.4) 6(0.75,-2.4) 7(1.25,-2.4) 8(1.75,-2.4) 17(1.75,2.4) 18(1.25,2.4) 19(0.75,2.4) 20(0.25,2.4) 21(-0.25,2.4) 22(-0.75,2.4) 23(-1.25,2.4) 24(-1.75,2.4)
  oval 0.8x0.28 smd: 9(2.4,-1.75) 10(2.4,-1.25) 11(2.4,-0.75) 12(2.4,-0.25) 13(2.4,0.25) 14(2.4,0.75) 15(2.4,1.25) 16(2.4,1.75) 25(-2.4,1.75) 26(-2.4,1.25) 27(-2.4,0.75) 28(-2.4,0.25) 29(-2.4,-0.25) 30(-2.4,-0.75) 31(-2.4,-1.25) 32(-2.4,-1.75)
  rect 3.4x3.4 smd: 33(0,-0.001)
R0603
  rect 0.806x0.864 smd: 1(-0.753,0) 2(0.753,0)
SENSOR-SMD_L3.0-W3.0-P1.00-BR
  rect 0.8x0.5 smd: 1(1,-1) 2(1,0) 3(1,1) 4(-1,1) 5(-1,0) 6(-1,-1)
SMA_L4.3-W2.6-LS5.2-RD
  rect 2x2 smd: 1(-2.2,0) 2(2.2,0)
SOD-323_L1.7-W1.3-LS2.5-FD
  rect 0.78x0.5 smd: 1(-1.04,0) 2(1.04,0)
SOIC-8_L4.9-W3.9-P1.27-LS6.0-BL-EP
  oval 0.602x1.941 smd: 1(-1.905,-2.72) 2(-0.635,-2.72) 3(0.635,-2.72) 4(1.905,-2.72) 5(1.905,2.72) 6(0.635,2.72) 7(-0.635,2.72) 8(-1.905,2.72)
  rect 3.098x2.41 smd: 9(0,0)
SOIC-8_L5.0-W4.0-P1.27-LS6.0-BL
  oval 0.569x1.95 smd: 1(-1.905,-2.705) 2(-0.635,-2.705) 3(0.635,-2.705) 4(1.905,-2.705) 5(1.905,2.705) 6(0.635,2.705) 7(-0.635,2.705) 8(-1.905,2.705)
SOP-16_L10.0-W3.9-P1.27-LS6.0-BL
  oval 0.56x1.745 smd: 1(-4.445,-2.873) 2(-3.175,-2.873) 3(-1.905,-2.873) 4(-0.635,-2.873) 5(0.635,-2.873) 6(1.905,-2.873) 7(3.175,-2.873) 8(4.445,-2.873) 9(4.445,2.873) 10(3.175,2.873) 11(1.905,2.873) 12(0.635,2.873) 13(-0.635,2.873) 14(-1.905,2.873) 15(-3.175,2.873) 16(-4.445,2.873)
SOT-23-3_L2.9-W1.3-P1.90-LS2.3-BR
  rect 1.07x0.532 smd: 1(0.99,-0.95) 2(0.99,0.95) 3(-0.99,0)
SOT-23-3_L2.9-W1.3-P1.90-LS2.4-BR
  rect 1x0.65 smd: 1(1,-0.95) 2(1,0.95) 3(-1,0)
SOT-23-3_L2.9-W1.4-P1.90-LS2.6-BR
  rect 0.91x0.6 smd: 1(1.055,-0.955) 2(1.055,0.955) 3(-1.055,0)
SOT-23-5_L2.9-W1.6-P0.95-LS2.8-BR
  rect 1x0.6 smd: 1(1.1,-0.95) 2(1.1,0) 3(1.1,0.95) 4(-1.1,0.95) 5(-1.1,-0.95)
SOT-23-6_L2.9-W1.6-P0.95-LS2.8-BL
  rect 0.532x1.072 smd: 1(-0.95,-1.149) 2(0,-1.149) 3(0.95,-1.149) 4(0.95,1.149) 5(0,1.149) 6(-0.95,1.149)
SW-SMD_2P-TS24CA
  rect 0.6x1.2 smd: 1(-1.7,-0.975) 2(1.7,-0.975)
  custom 1.05x1.3 smd: 3(2.125,0.975) 4(-2.125,0.975)
SW-TH_MSK12C02
  rect 0.6x1.524 smd: 1(-2.25,1.7) 2(0.75,1.7) 3(2.25,1.7)
  rect 1.2x0.7 smd: 4(-3.6,0.6) 4(-3.6,-1.7) 4(3.6,0.6) 4(3.6,-1.7)
TSSOP-24_L7.8-W4.4-P0.65-LS6.4-BL
  rect 0.4x1.65 smd: 1(-3.575,-3.022) 2(-2.925,-3.022) 3(-2.275,-3.022) 4(-1.625,-3.022) 5(-0.975,-3.022) 6(-0.325,-3.022) 7(0.325,-3.022) 8(0.975,-3.022) 9(1.625,-3.022) 10(2.275,-3.022) 11(2.925,-3.022) 12(3.575,-3.022) 13(3.575,3.022) 14(2.925,3.022) 15(2.275,3.022) 16(1.625,3.022) 17(0.975,3.022) 18(0.325,3.022) 19(-0.325,3.022) 20(-0.975,3.022) 21(-1.625,3.022) 22(-2.275,3.022) 23(-2.925,3.022) 24(-3.575,3.022)
USB-C-SMD_TYPE-C-16PIN-2MD-073
  oval 1.1x1.9 hole 0.6x1.3: 13(-4.325,1.825) 14(4.325,1.825)
  oval 1.2x1.6 hole 0.6x1: 13(-4.325,-2.375) 14(4.325,-2.375)
  rect 0.55x1.1 smd: A1B12(-3.2,2.375) A4B9(-2.4,2.375) B1A12(3.2,2.375) B4A9(2.4,2.375)
  rect 0.3x1.1 smd: A5(-1.25,2.375) A6(-0.25,2.375) A7(0.25,2.375) A8(1.25,2.375) B5(1.75,2.375) B6(0.75,2.375) B7(-0.75,2.375) B8(-1.75,2.375)
WIRELM-SMD_ESP32-S3-WROOM-1
  rect 1.5x0.9 smd: 1(-8.75,8.895) 2(-8.75,7.625) 3(-8.75,6.355) 4(-8.75,5.085) 5(-8.75,3.815) 6(-8.75,2.545) 7(-8.75,1.275) 8(-8.75,0.005) 9(-8.75,-1.265) 10(-8.75,-2.535) 11(-8.75,-3.805) 12(-8.75,-5.075) 13(-8.75,-6.345) 14(-8.75,-7.615) 27(8.75,-7.615) 28(8.75,-6.345) 29(8.75,-5.075) 30(8.75,-3.805) 31(8.75,-2.535) 32(8.75,-1.265) 33(8.75,0.005) 34(8.75,1.275) 35(8.75,2.545) 36(8.75,3.815) 37(8.75,5.085) 38(8.75,6.355) 39(8.75,7.625) 40(8.75,8.895)
  rect 0.9x1.5 smd: 15(-6.985,-8.895) 16(-5.715,-8.895) 17(-4.445,-8.895) 18(-3.175,-8.895) 19(-1.905,-8.895) 20(-0.635,-8.895) 21(0.635,-8.895) 22(1.905,-8.895) 23(3.175,-8.895) 24(4.445,-8.895) 25(5.715,-8.895) 26(6.985,-8.865)
  rect 0.9x0.9 smd: 41(-2.9,2.575) 41(-2.9,1.175) 41(-2.9,-0.225) 41(-1.5,2.575) 41(-1.5,1.175) 41(-1.5,-0.225) 41(-0.1,2.575) 41(-0.1,1.175) 41(-0.1,-0.225)

## Nets
As in the schematic, except:
+3.3V_A: C36.2 C37.2 C54.2 C55.2 R6.1 R26.2 R27.2 U7.5 U10.16
AGND: C48.1 C51.1 C52.1 C53.1 C54.1 C55.1 C56.1 C61.1 C62.1 C63.1 C64.1 C65.1 R25.2 R33.1 U10.13 U10.18 U10.29 U15.3 U15.4
GND: +3.3v.1 +5v.1 C1.1 C2.1 C3.2 C4.2 C5.1 C6.1 C7.1 C8.1 C9.1 C10.1 C11.1 C12.1 C13.1 C14.1 C15.1 C16.1 C17.1 C18.1 C19.1 C20.1 C21.2 C22.2 C23.2 C24.2 C26.1 C27.1 C28.1 C29.1 C30.1 C31.1 C33.1 C34.2 C35.1 C36.1 C37.1 C38.1 C39.1 C40.1 C41.1 C42.1 C43.1 C44.1 C45.1 C46.1 C47.1 C49.1 C50.1 C67.2 C68.1 C69.2 C70.2 C71.2 C72.1 C73.1 C74.1 C75.1 C76.2 C77.2 C78.1 C79.1 C80.1 C81.1 C82.1 C83.1 C84.1 C85.1 C86.1 C87.1 C88.2 C89.1 C90.1 C91.1 C92.1 C93.1 C94.1 C96.2 C97.1 C98.1 C99.1 C100.1 C101.1 C103.2 C104.1 CN2.3 CN2.4 D1.2 D6.2 ESP_BOOT.1 ESP_BOOT.2 ESP_RES.3 ESP_RES.4 Q2.2 R8.2 R25.1 R43.1 R44.1 R45.1 R49.1 R54.1 R56.1 STM_BOOT1.1 STM_BOOT1.4 STM_RES1.3 STM_RES1.4 SW2.1 U1.10 U1.20 U1.27 U1.74 U1.99 U2.1 U2.40 U2.41 U3.7 U3.9 U4.2 U5.2 U6.7 U6.31 U6.33 U7.2 U8.1 U9.2 U9.3 U9.21 U10.4 U10.26 U11.7 U12.5 U13.2 U14.2 U17.1 USB1.A1B12 USB1.B1A12 X3.2 右前腿.3 右后腿.3 左前腿.3 左后腿.3 摄像头.2 摄像头.15 摄像头.23 显示屏.1 显示屏.15
VCC: C67.1 C85.2 C87.2 C88.1 U8.16 U16.7
CH340_D+: U8.6 U16.1 USB1.A6 USB1.B6
CH340_D-: U8.5 U16.2 USB1.A7 USB1.B7
ESP_BOOT: ESP_BOOT.3 ESP_BOOT.4 Q1.3 Q4.3 U2.27
ESP_GPIO_43: U2.37 U8.3 U16.9 显示屏.12
ESP_GPIO_44: U2.36 U8.2 U16.8 显示屏.11
ESP_RESET: C3.1 ESP_RES.1 ESP_RES.2 Q3.3 Q5.3 R5.1 U2.3
ESP_USB_VBUS: C90.2 F1.2 Q7.3 Q8.3 Q9.3 Q10.3 R46.2 U6.10 USB1.A4B9 USB1.B4A9
MIC_LIN1: C57.1 C66.1 U10.24
$1N13: D1.5 D2.1 F1.1
$1N96: C68.2 U17.4
$1N113: Q4.2 R16.2 U16.5
$1N114: Q5.2 R15.2 U16.4
$1N115: Q5.1 R16.1
$1N116: Q4.1 R15.1
$6N3: C59.2 R33.2
$6N6: C56.2 C57.2 R28.2
$6N12: C48.2 C51.2 R26.1 R28.1

Pads without a net: BUZZER1 3 4; CN2 1 5 8 9 10; SW2 3 4; U4 4; U5 4; U6 3 4 25 26 27 28 29 30; U7 4; U8 7 8 9 10 11 12 15; U9 8 9 10 11 12 13 14 15 16 17 18 19 20; U10 9 11 12 21 22 23 25; U12 1 6; U13 4; U14 4; U16 3 6 10; U17 5 6 7 8 9 10 11 12 13 14 15 16; USB1 13 14 A8 B8; X3 1; 右前腿 4 5; 右后腿 4 5; 左前腿 4 5; 左后腿 4 5; 扬声器 3 4; 摄像头 25 26; 显示屏 17 18; 触摸_1 3 4; 触摸_2 3 4
